# Altium schematic sheet Orion-Bridge-R3.SchDoc
size A2
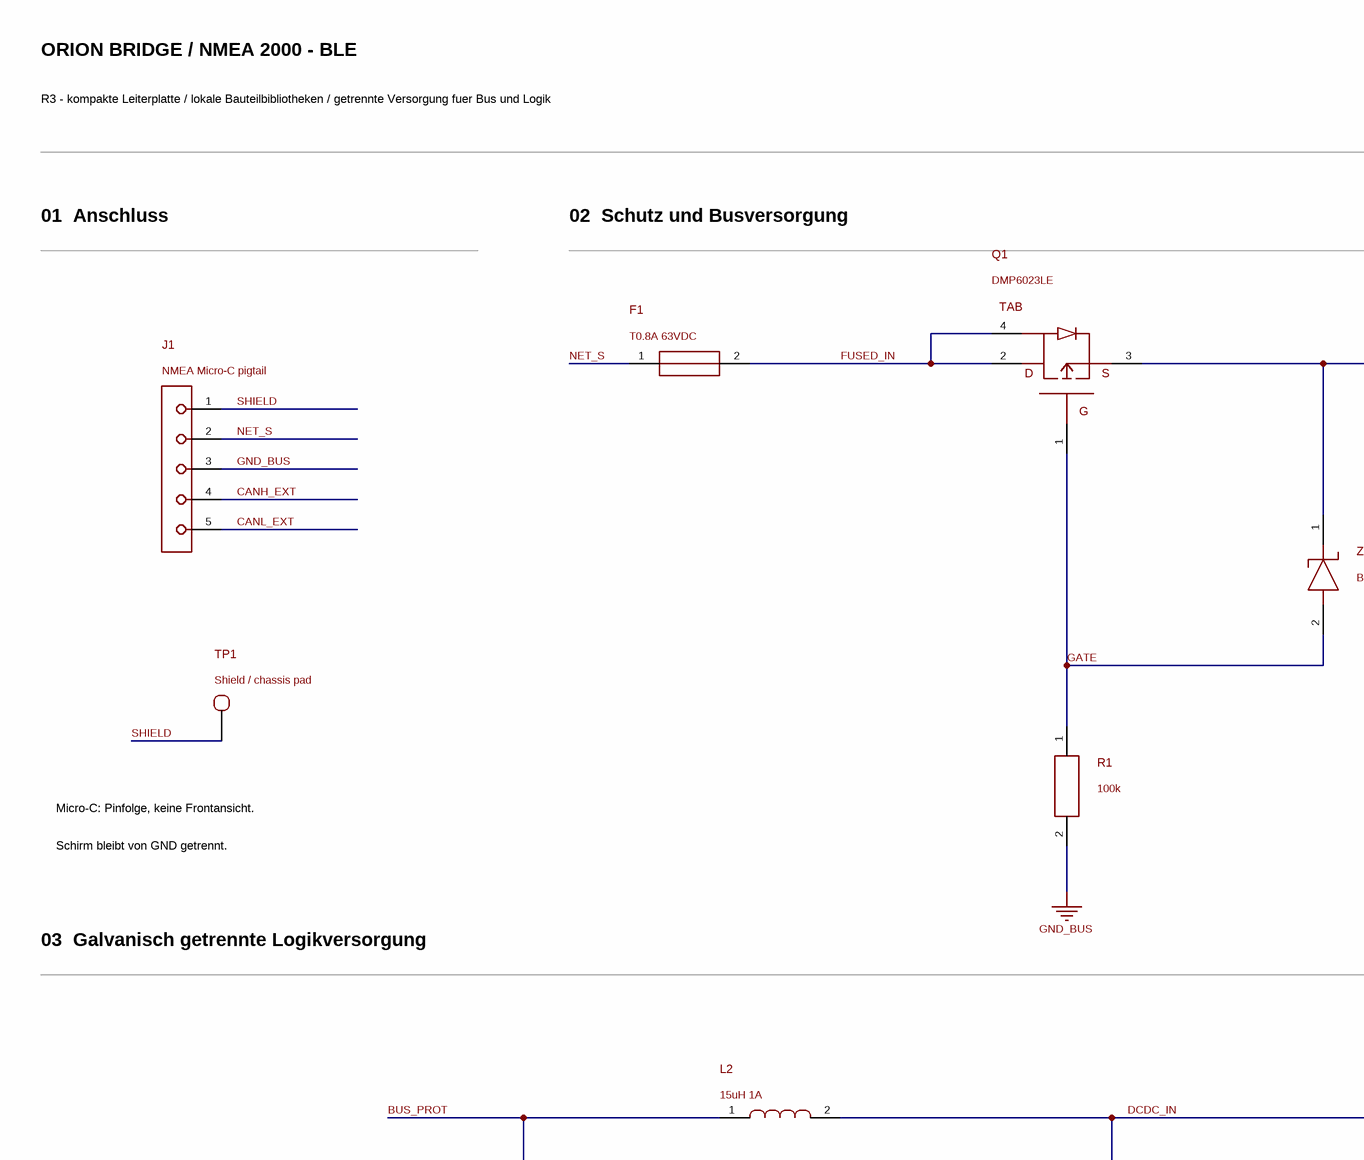
[diagram p0: Orion-Bridge-R3.SchDoc, top left]
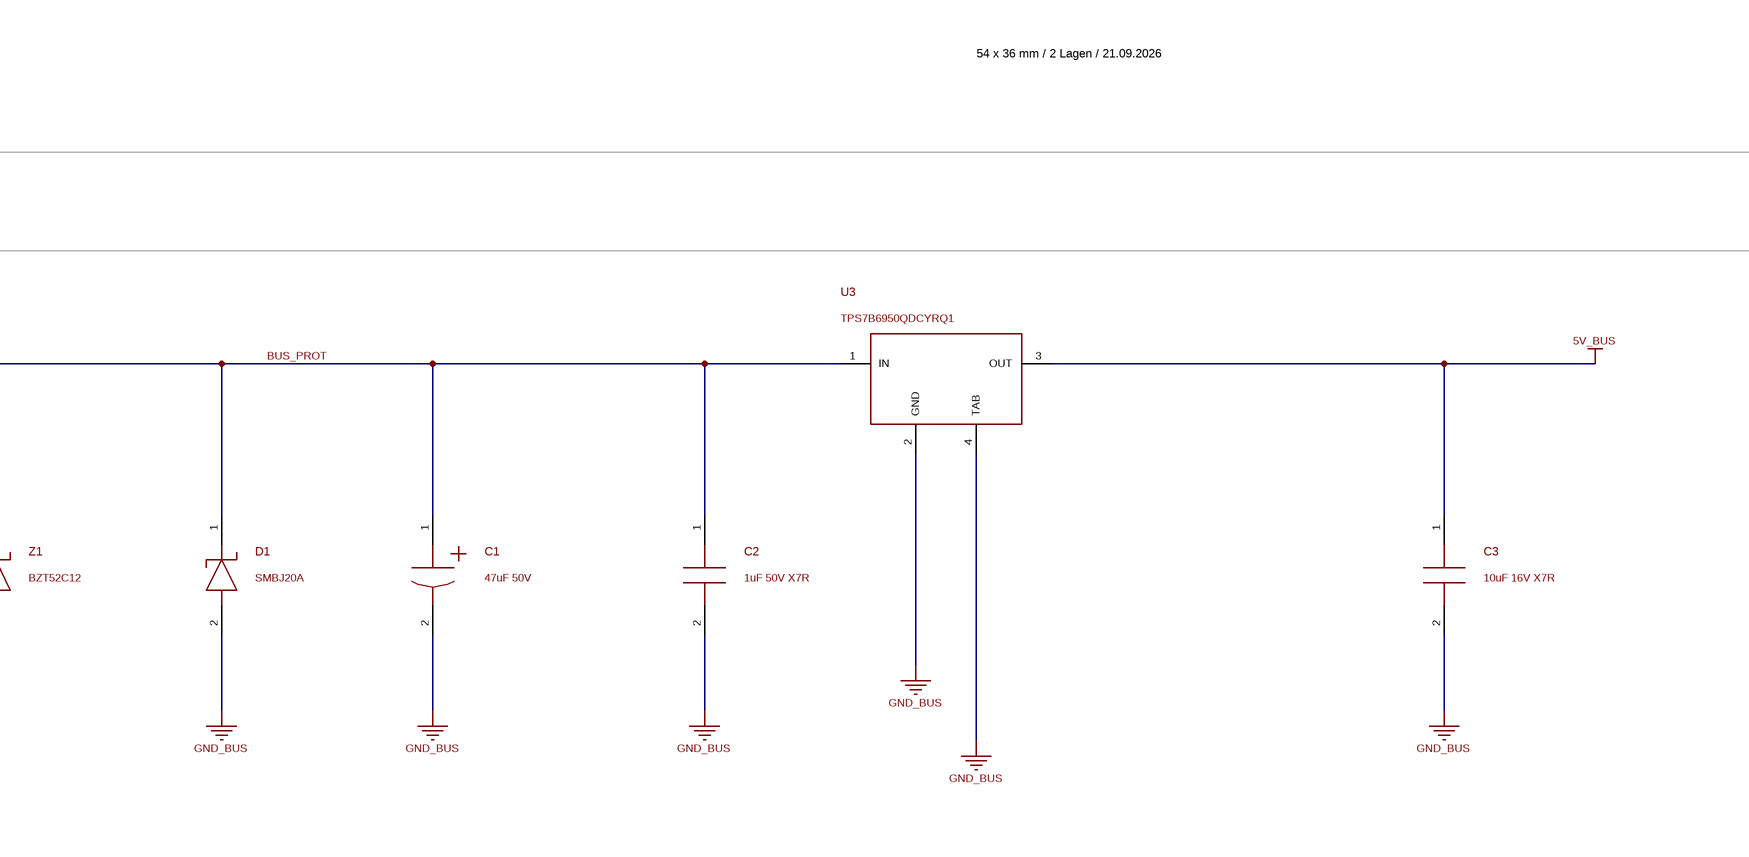
[diagram p1: Orion-Bridge-R3.SchDoc, top right]
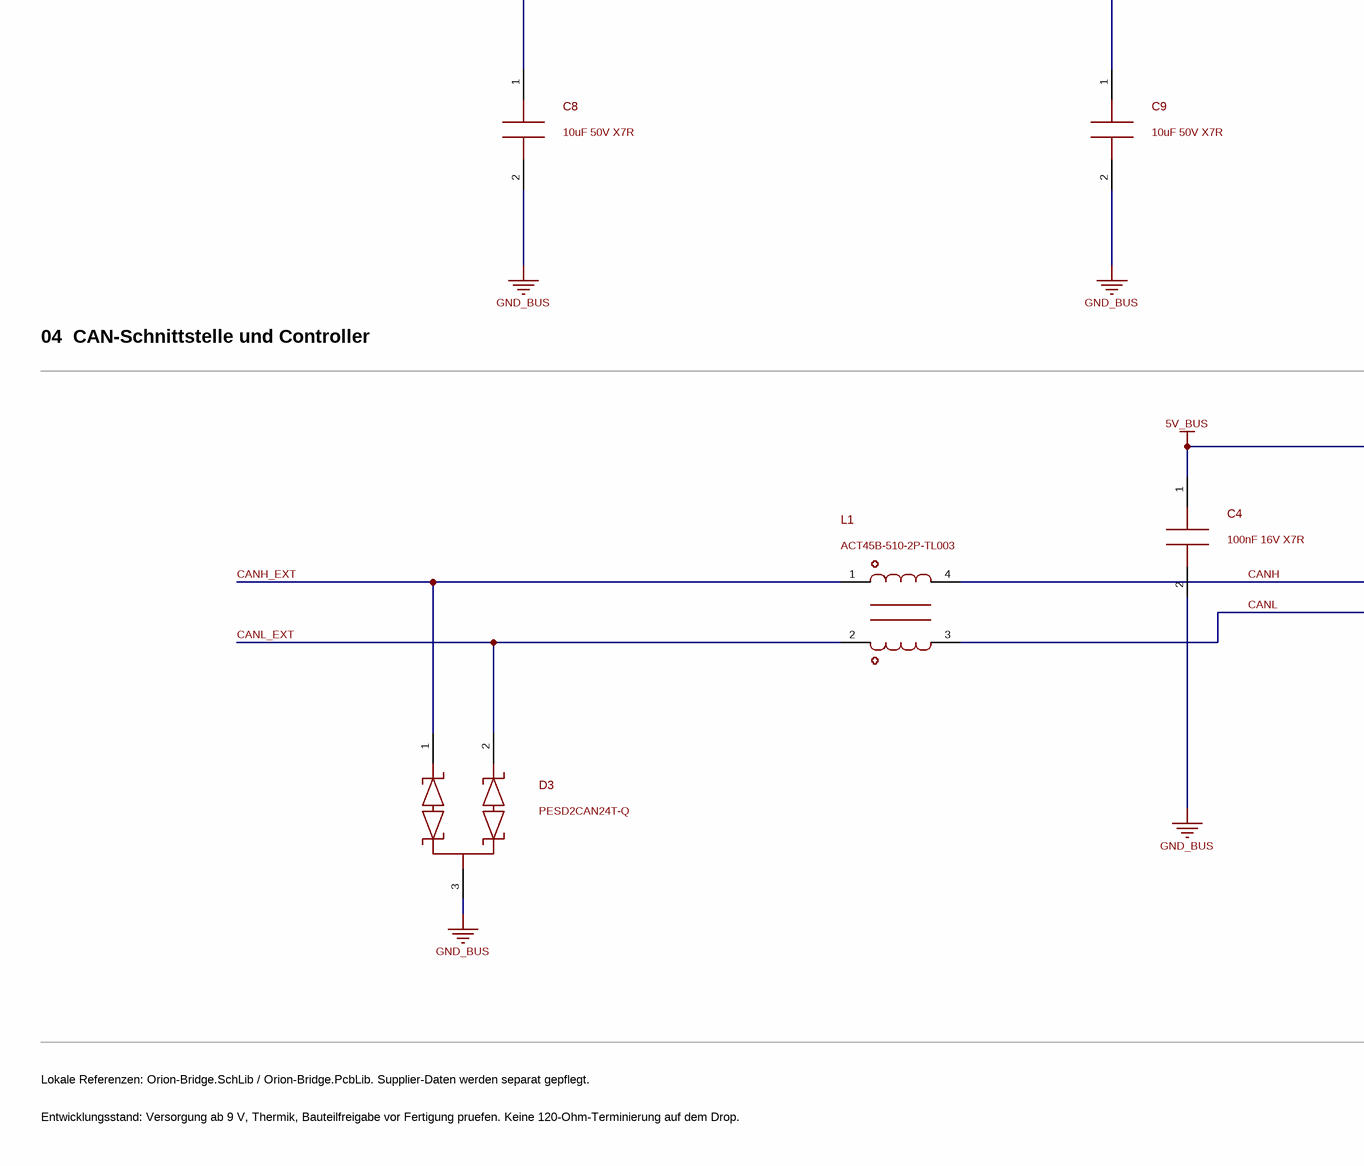
[diagram p2: Orion-Bridge-R3.SchDoc, bottom left]
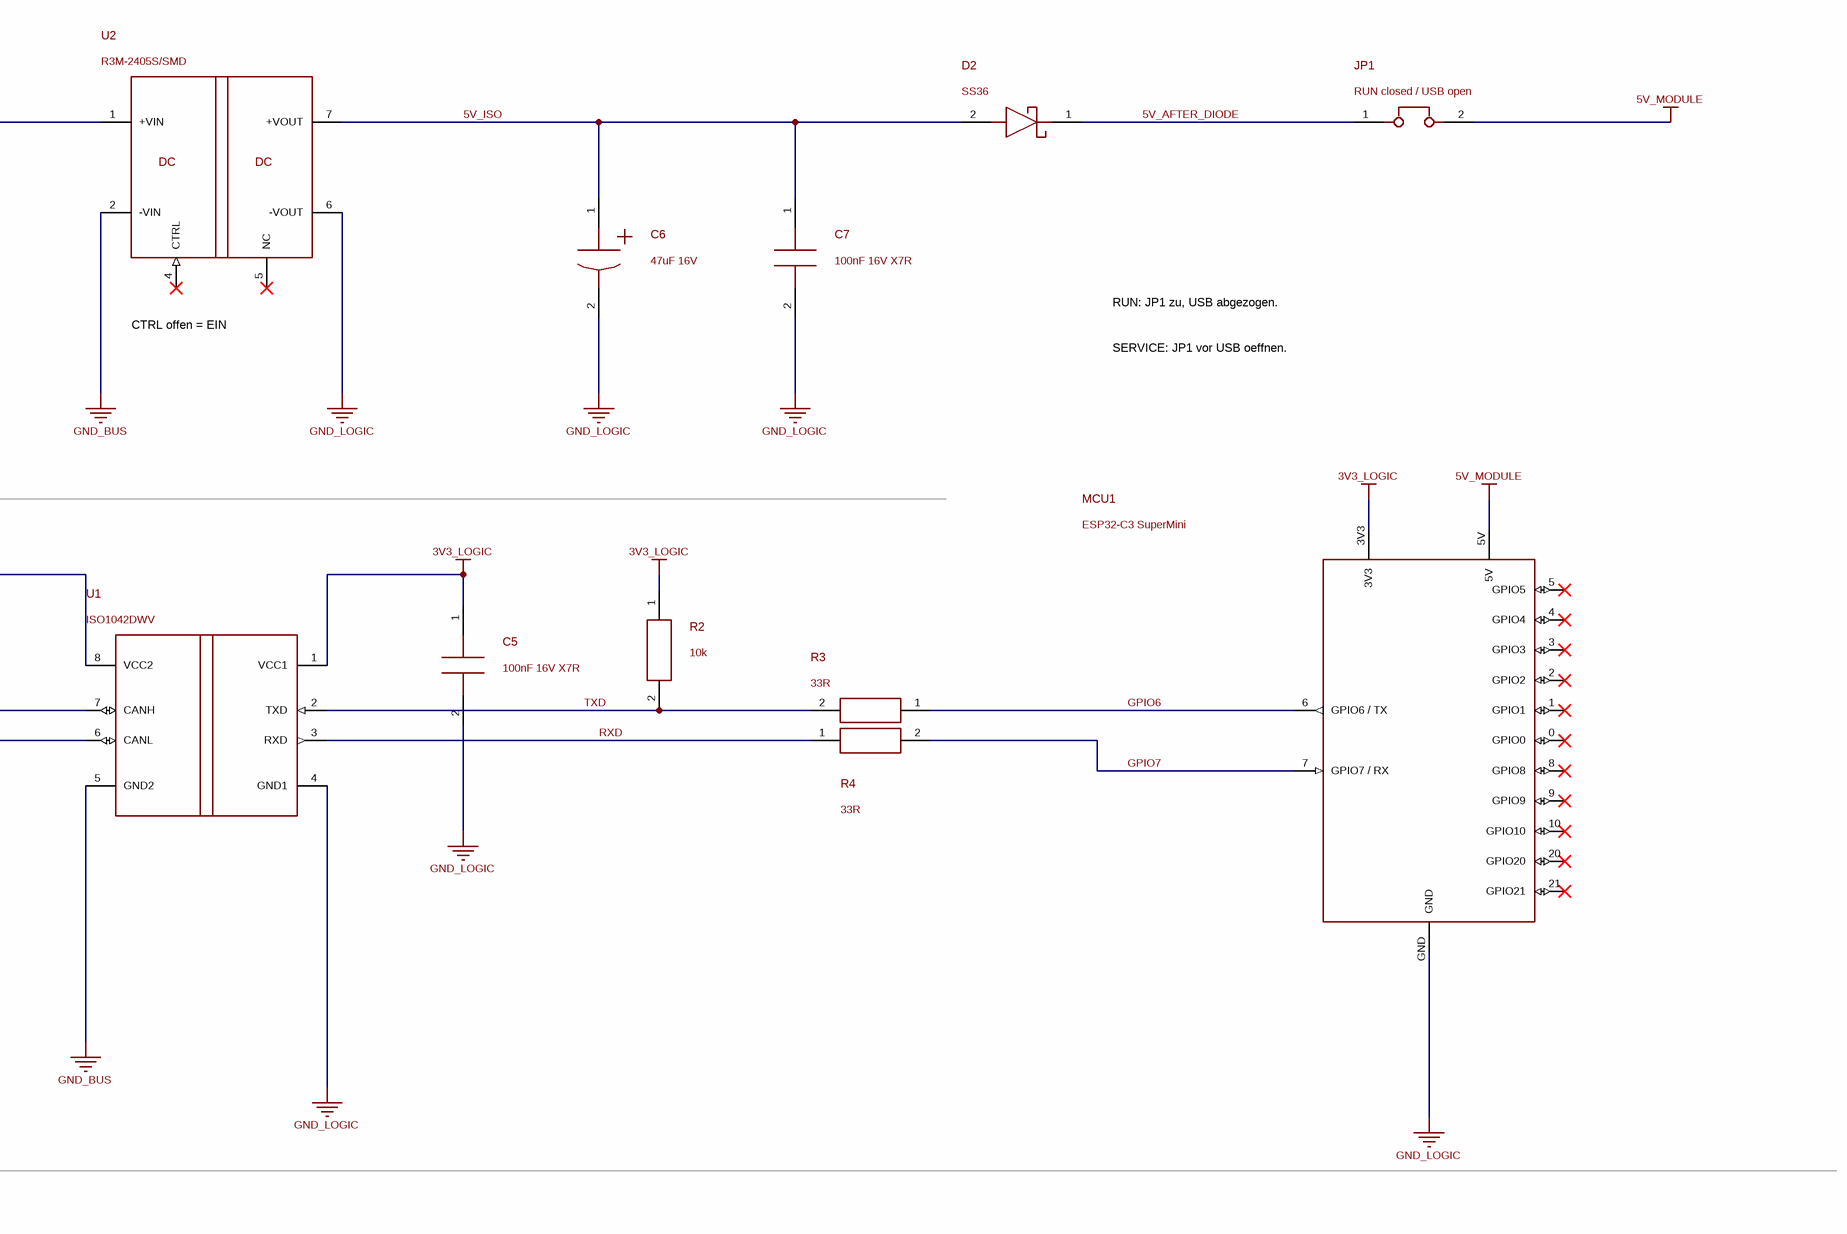
[diagram p3: Orion-Bridge-R3.SchDoc, bottom right]

## Parts
C1  47uF 50V  [PANASONIC_FT_D6P3]
C2  1uF 50V X7R  [C0805]
C3  10uF 16V X7R  [C1206]
C4  100nF 16V X7R  [C0805]
C5  100nF 16V X7R  [C0805]
C6  47uF 16V  [PANASONIC_FT_D4]
C7  100nF 16V X7R  [C0805]
C8  10uF 50V X7R  [C1210]
C9  10uF 50V X7R  [C1210]
D1  SMBJ20A  [SMB]
D2  SS36  [SMB]
D3  PESD2CAN24T-Q  [SOT23_NEXPERIA_REFLOW]
F1  T0.8A 63VDC  [BOURNS_SF1206S]
J1  NMEA Micro-C pigtail  [PIGTAIL_5_P3_D1P3]
JP1  RUN closed / USB open  [HDR1X2_2.54]
L1  ACT45B-510-2P-TL003  [ACT45B]
L2  15uH 1A  [BOURNS_SRN4018]
MCU1  ESP32-C3 SuperMini  [NOLOGO_C3_SUPERMINI_THT_2X8]
Q1  DMP6023LE  [SOT223_DIODES_DMP6023LE]
R1  100k  [R0805]
R2  10k  [R0805]
R3  33R  [R0805]
R4  33R  [R0805]
TP1  Shield / chassis pad  [TESTPOINT_2MM]
U1  ISO1042DWV  [SOIC8_DWV]
U2  R3M-2405S/SMD  [R3M_SMD]
U3  TPS7B6950QDCYRQ1  [SOT223_LDO]
Z1  BZT52C12  [SOD123]

## Nets
3V3_LOGIC: C5.1 MCU1.3V3 R2.1 U1.1(VCC1)
5V_BUS: C3.1 C4.1 U1.8(VCC2) U3.3(OUT)
5V_MODULE: JP1.2 MCU1.5V
GND_BUS: C1.2(-) C2.2 C3.2 C4.2 C8.2 C9.2 D1.2(A) D3.3(CC) J1.3(NET-C) R1.2 U1.5(GND2) U2.2(-VIN) U3.2(GND) U3.4(TAB)
GND_LOGIC: C5.2 C6.2(-) C7.2 MCU1.GND U1.4(GND1) U2.6(-VOUT)
5V_AFTER_DIODE: D2.1(K) JP1.1
5V_ISO: C6.1(+) C7.1 D2.2(A) U2.7(+VOUT)
BUS_PROT: C1.1(+) C2.1 C8.1 D1.1(K) L2.1 Q1.3(S) U3.1(IN) Z1.1(K)
CANH: L1.4(H_IC) U1.7(CANH)
CANH_EXT: D3.1(K1) J1.4(CAN-H) L1.1(H_EXT)
CANL: L1.3(L_IC) U1.6(CANL)
CANL_EXT: D3.2(K2) J1.5(CAN-L) L1.2(L_EXT)
DCDC_IN: C9.1 L2.2 U2.1(+VIN)
FUSED_IN: F1.2 Q1.2(D) Q1.4(TAB=D)
GATE: Q1.1(G) R1.1 Z1.2(A)
GPIO6: MCU1.6(GPIO6_/_TX) R3.1
GPIO7: MCU1.7(GPIO7_/_RX) R4.2
NET_S: F1.1 J1.2(NET-S)
RXD: R4.1 U1.3(RXD)
SHIELD: J1.1(SHIELD) TP1.1(SHIELD)
TXD: R2.2 R3.2 U1.2(TXD)

Not connected (* = marked no-connect by the designer): MCU1 0(GPIO0)* 1(GPIO1)* 2(GPIO2)* 3(GPIO3)* 4(GPIO4)* 5(GPIO5)* 8(GPIO8)* 9(GPIO9)* 10(GPIO10)* 20(GPIO20)* 21(GPIO21)*; U2 4(CTRL)* 5(NC)*

## Notes on the sheet
- ORION BRIDGE / NMEA 2000 - BLE
- 54 x 36 mm / 2 Lagen / 21.09.2026
- R3 - kompakte Leiterplatte / lokale Bauteilbibliotheken / getrennte Versorgung fuer Bus und Logik
- 01  Anschluss
- 02  Schutz und Busversorgung
- Micro-C: Pinfolge, keine Frontansicht.
- Schirm bleibt von GND getrennt.
- 03  Galvanisch getrennte Logikversorgung
- CTRL offen = EIN
- RUN: JP1 zu, USB abgezogen.
- SERVICE: JP1 vor USB oeffnen.
- 04  CAN-Schnittstelle und Controller
- Lokale Referenzen: Orion-Bridge.SchLib / Orion-Bridge.PcbLib. Supplier-Daten werden separat gepflegt.
- Entwicklungsstand: Versorgung ab 9 V, Thermik, Bauteilfreigabe vor Fertigung pruefen. Keine 120-Ohm-Terminierung auf dem Drop.
- (in symbol DMP6023LE) TAB
- (in symbol R3M-2405S_SMD) DC

## Library data of the parts
C1 = CAP_PANASONIC_EEEFT1H470AP: 47 uF 50 V FT-series SMD aluminum electrolytic, size D, standard product; Manufacturer: Panasonic Industry; ReviewStatus: Manufacturer recommended lands verified from primary datasheet; assembly/electrical qualification remains; MPN: EEEFT1H470AP; Manufacturer Part Number: EEEFT1H470AP; Datasheet: https://industrial.panasonic.com/cdbs/www-data/pdf/RDE0000/ABA0000C1240.pdf; Footprint Status: Manufacturer recommended lands verified from primary datasheet; assembly/electrical qualification remains
C2 = C_0805_1UF_50V_X7R: 1uF 50V X7R - generic specification; manufacturer/MPN not selected; ReviewStatus: PROVISIONAL - verify landpattern before fabrication; Footprint Status: PROVISIONAL - verify landpattern before fabrication
C3 = C_1206_10UF_16V_X7R: 10uF 16V X7R - generic specification; manufacturer/MPN not selected; ReviewStatus: PROVISIONAL - verify landpattern before fabrication; Footprint Status: PROVISIONAL - verify landpattern before fabrication
C4 C5 C7 = C_0805_100NF_16V_X7R: 100nF 16V X7R - generic specification; manufacturer/MPN not selected; ReviewStatus: PROVISIONAL - verify landpattern before fabrication; Footprint Status: PROVISIONAL - verify landpattern before fabrication
C6 = CAP_PANASONIC_EEEFT1C470AR: 47 uF 16 V FT-series SMD aluminum electrolytic, size B, standard product; Manufacturer: Panasonic Industry; ReviewStatus: Manufacturer recommended lands verified from primary datasheet; assembly/electrical qualification remains; MPN: EEEFT1C470AR; Manufacturer Part Number: EEEFT1C470AR; Datasheet: https://industrial.panasonic.com/cdbs/www-data/pdf/RDE0000/ABA0000C1240.pdf; Footprint Status: Manufacturer recommended lands verified from primary datasheet; assembly/electrical qualification remains
C8 C9 = C_1210_10UF_50V_X7R: 10uF 50V X7R - generic specification; manufacturer/MPN not selected; ReviewStatus: PROVISIONAL - verify landpattern before fabrication; Footprint Status: PROVISIONAL - verify landpattern before fabrication
D1 = SMBJ20A_SMB_GENERIC: SMBJ20A - generic specification; manufacturer/MPN not selected; ReviewStatus: PROVISIONAL - verify landpattern before fabrication; Footprint Status: PROVISIONAL - verify landpattern before fabrication
D2 = SS36_SMB_GENERIC: SS36 - generic specification; manufacturer/MPN not selected; ReviewStatus: PROVISIONAL - verify landpattern before fabrication; Footprint Status: PROVISIONAL - verify landpattern before fabrication
D3 = PESD2CAN24T-QR: Manufacturer: Nexperia; ReviewStatus: Nexperia PESD2CAN24T-Q datasheet Fig10 reflow lands, 9-Feb-2024 p8; MPN: PESD2CAN24T-QR; Manufacturer Part Number: PESD2CAN24T-QR; Datasheet: https://assets.nexperia.com/documents/data-sheet/PESD2CAN24T-Q.pdf; Footprint Status: Nexperia PESD2CAN24T-Q datasheet Fig10 reflow lands, 9-Feb-2024 p8
F1 = FUSE_BOURNS_SF1206S080: 0.8 A slow-blow SMD ceramic fuse, 63 VDC, 50 A interrupt rating; Manufacturer: Bourns; MPN: SF-1206S080-2; ReviewStatus: Manufacturer recommended lands verified from primary datasheet; assembly/electrical qualification remains; Manufacturer Part Number: SF-1206S080-2; Datasheet: https://www.bourns.com/docs/product-datasheets/sf-1206s.pdf; Footprint Status: Manufacturer recommended lands verified from primary datasheet; assembly/electrical qualification remains
J1 = NMEA_PIGTAIL_5_P3_D1P3: Five direct wire-solder pads for a separately selected Micro-C cable; this is a PCB interface, not an invented connector MPN or face view; ReviewStatus: Designed wire interface; cable conductor and strain relief selection pending; Footprint Status: Designed wire interface; cable conductor and strain relief selection pending
JP1 = JUMPER_1X2_P2_54: RUN closed / USB open - generic specification; manufacturer/MPN not selected; ReviewStatus: PROVISIONAL - verify landpattern before fabrication; Footprint Status: PROVISIONAL - verify landpattern before fabrication
L1 = ACT45B5102PTL003: Manufacturer: TDK; ReviewStatus: PROVISIONAL - verify landpattern before fabrication; MPN: ACT45B5102PTL003; Manufacturer Part Number: ACT45B5102PTL003; Datasheet: https://www.tdk-electronics.tdk.com/inf/30/ds/act45b.pdf; Footprint Status: PROVISIONAL - verify landpattern before fabrication
L2 = IND_BOURNS_SRN4018_150M: 15 uH semi-shielded power inductor, 1.0 A RMS and 1.1 A saturation rating; Manufacturer: Bourns; MPN: SRN4018-150M; ReviewStatus: Manufacturer recommended lands verified from primary datasheet; assembly/electrical qualification remains; Manufacturer Part Number: SRN4018-150M; Datasheet: https://www.bourns.com/docs/product-datasheets/srn4018.pdf; Footprint Status: Manufacturer recommended lands verified from primary datasheet; assembly/electrical qualification remains
MCU1 = ESP32_C3_SUPERMINI_NOLOGO: Nologo ESP32-C3 SuperMini module, two 1x8 carrier headers, GPIO6 TX / GPIO7 RX; Manufacturer: Nologo Tech; ReviewStatus: Nologo source-based header pin geometry. Local model assumes 3.1 mm underside clearance and 7.2 mm total height; no separate socket part is specified.; MPN: ESP32-C3 SuperMini; Manufacturer Part Number: ESP32-C3 SuperMini; Datasheet: https://github.com/NologoTech/ESP32C3-Supermini/tree/main/Hardware; Footprint Status: Nologo source-based header pin geometry. Local model assumes 3.1 mm underside clearance and 7.2 mm total height; no separate socket part is specified.
Q1 = DMP6023LE: Manufacturer: Diodes Incorporated; ReviewStatus: Diodes manufacturer suggested land pattern, DS37199 Rev.3-2 p6; MPN: DMP6023LE; Manufacturer Part Number: DMP6023LE; Datasheet: https://www.diodes.com/datasheet/download/DMP6023LE.pdf; Footprint Status: Diodes manufacturer suggested land pattern, DS37199 Rev.3-2 p6
R1 = R_0805_100K: 100k - generic specification; manufacturer/MPN not selected; ReviewStatus: PROVISIONAL - verify landpattern before fabrication; Footprint Status: PROVISIONAL - verify landpattern before fabrication
R2 = R_0805_10K: 10k - generic specification; manufacturer/MPN not selected; ReviewStatus: PROVISIONAL - verify landpattern before fabrication; Footprint Status: PROVISIONAL - verify landpattern before fabrication
R3 = R_0805_33R: 33R - generic specification; manufacturer/MPN not selected; Role: R_TX; ReviewStatus: PROVISIONAL - verify landpattern before fabrication; Footprint Status: PROVISIONAL - verify landpattern before fabrication
R4 = R_0805_33R: 33R - generic specification; manufacturer/MPN not selected; Role: R_RX; ReviewStatus: PROVISIONAL - verify landpattern before fabrication; Footprint Status: PROVISIONAL - verify landpattern before fabrication
TP1 = TESTPOINT_2MM: Shield / chassis pad - generic specification; manufacturer/MPN not selected; ReviewStatus: PROVISIONAL - verify landpattern before fabrication; Footprint Status: PROVISIONAL - verify landpattern before fabrication
U1 = ISO1042DWV: Manufacturer: Texas Instruments; ReviewStatus: PROVISIONAL - verify landpattern before fabrication; MPN: ISO1042DWV; Manufacturer Part Number: ISO1042DWV; Datasheet: https://www.ti.com/lit/ds/symlink/iso1042.pdf; Footprint Status: PROVISIONAL - verify landpattern before fabrication
U2 = R3M-2405S_SMD: Manufacturer: RECOM; ReviewStatus: PROVISIONAL - verify landpattern before fabrication; MPN: R3M-2405S/SMD; Manufacturer Part Number: R3M-2405S/SMD; Datasheet: https://recom-power.com/pdf/Econoline/R3M.pdf; Footprint Status: PROVISIONAL - verify landpattern before fabrication
U3 = TPS7B6950QDCYRQ1: Manufacturer: Texas Instruments; ReviewStatus: TI DCY mechanical envelope verified; R2 engineering lands retained, not manufacturer-recommended lands. Thermal/assembly qualification required.; MPN: TPS7B6950QDCYRQ1; Manufacturer Part Number: TPS7B6950QDCYRQ1; Datasheet: https://www.ti.com/lit/ds/symlink/tps7b69-q1.pdf; Footprint Status: TI DCY mechanical envelope verified; R2 engineering lands retained, not manufacturer-recommended lands. Thermal/assembly qualification required.
Z1 = BZT52C12_SOD123_GENERIC: BZT52C12 - generic specification; manufacturer/MPN not selected; ReviewStatus: PROVISIONAL - verify landpattern before fabrication; Footprint Status: PROVISIONAL - verify landpattern before fabrication